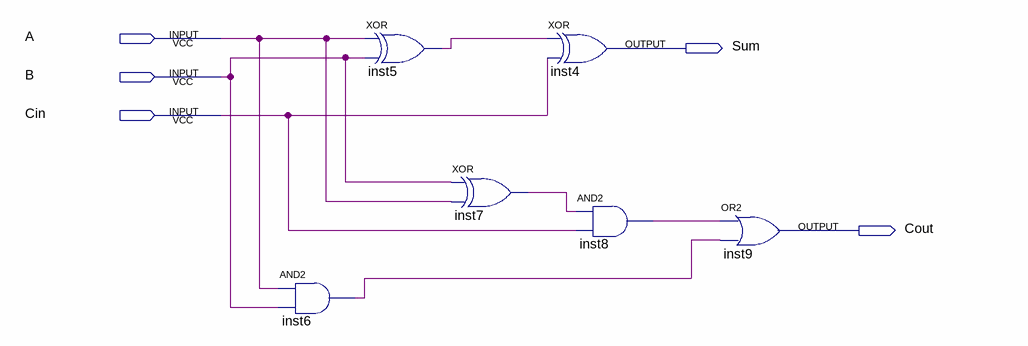
[diagram p0: schematic sheet]
// Quartus schematic template.bdf as structural Verilog: 6 symbols, 5 pins
module template (
  input  A,
  input  B,
  input  Cin,
  output Sum,
  output Cout
);

  wire inst5_out, inst6_out, inst7_out, inst8_out;

  and inst6 (inst6_out, A, B);
  xor inst5 (inst5_out, A, B);
  xor inst7 (inst7_out, B, A);
  xor inst4 (Sum, inst5_out, Cin);
  and inst8 (inst8_out, inst7_out, Cin);
  or inst9 (Cout, inst8_out, inst6_out);
endmodule
